# Altium schematic sheet ACMains_Connection_Sheet.SchDoc
size 420 x 297 mm
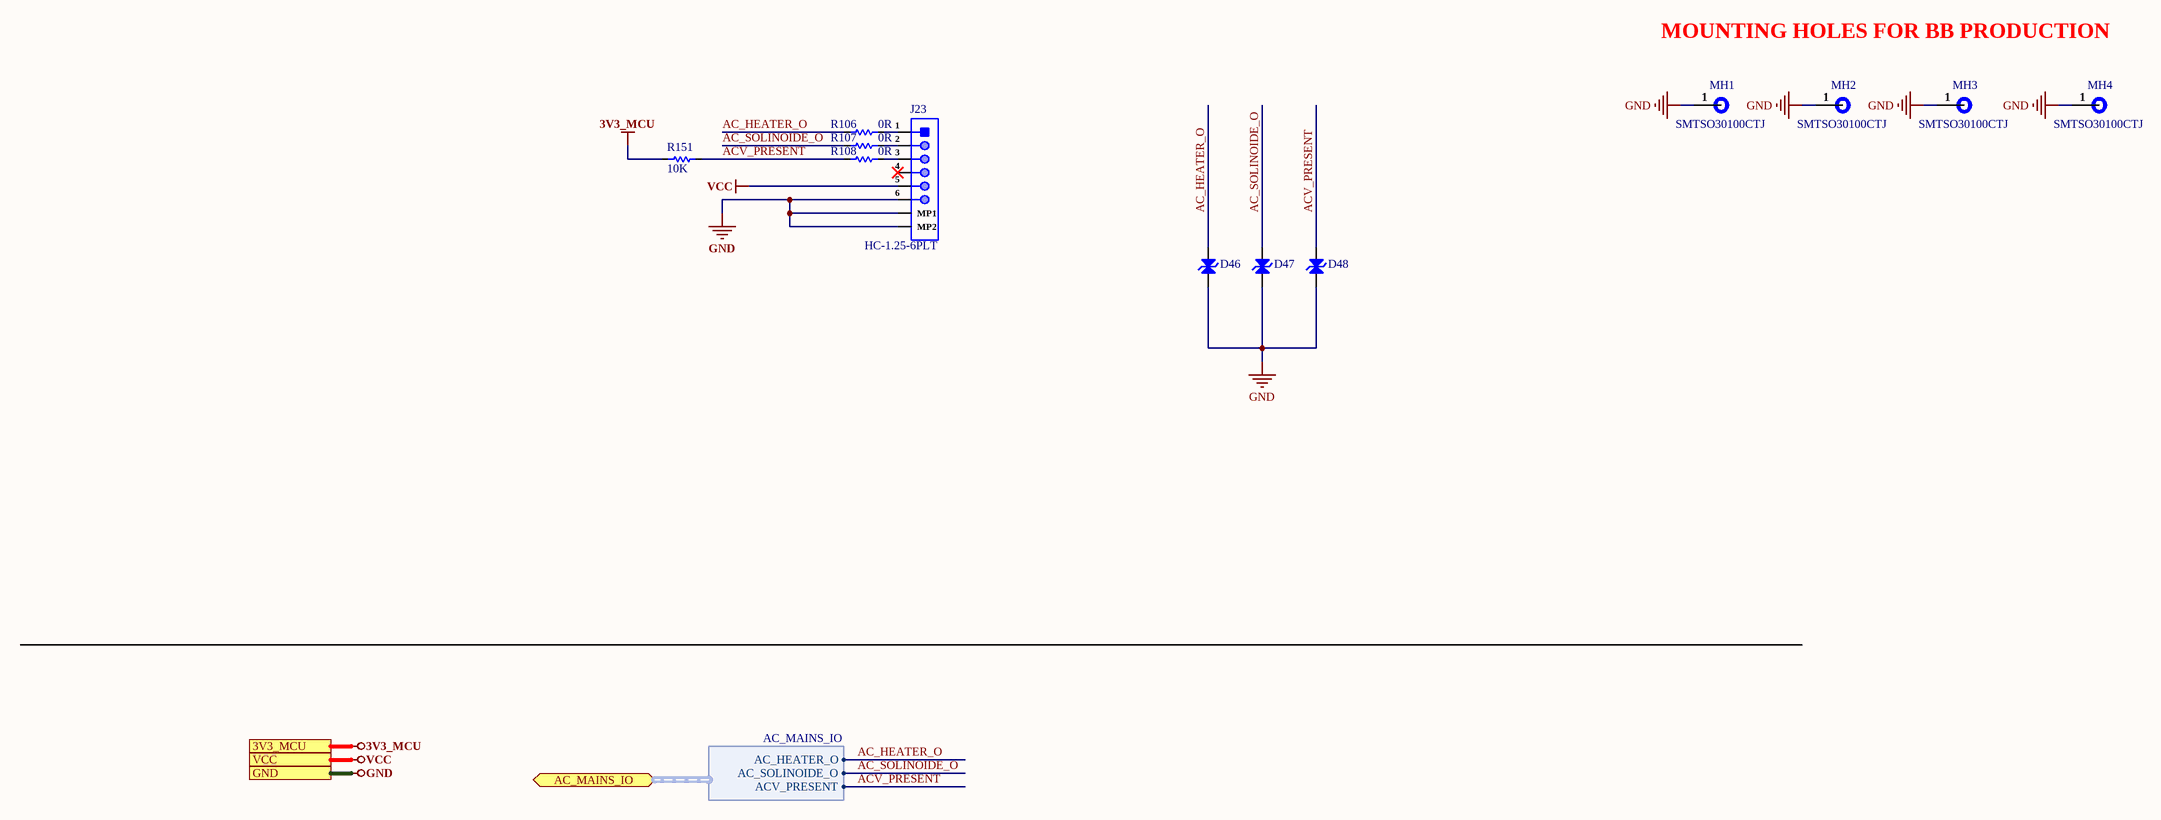
[diagram p0: ACMains_Connection_Sheet.SchDoc]

## Parts
D46  LESD8D3.3CAT5G  [SOD-882 Bi Directional]  (value not drawn)
D47  LESD8D3.3CAT5G  [SOD-882 Bi Directional]  (value not drawn)
D48  LESD8D3.3CAT5G  [SOD-882 Bi Directional]  (value not drawn)
J23  HC-1.25-6PLT  [HC-1.25-6PLT]
MH1  SMTSO30100CTJ  [SMTSO30100CTJ-]
MH2  SMTSO30100CTJ  [SMTSO30100CTJ-]
MH3  SMTSO30100CTJ  [SMTSO30100CTJ-]
MH4  SMTSO30100CTJ  [SMTSO30100CTJ-]
R106  0R  [Res-0603]
R107  0R  [Res-0603]
R108  0R  [Res-0603]
R151  10K  [Res-0603]

## Ports
3V3_MCU, AC_MAINS_IO (bidir, harness AC_MAINS_IO), GND, VCC

## Harnesses
AC_MAINS_IO: AC_HEATER_O, AC_SOLINOIDE_O, ACV_PRESENT

## Nets
3V3_MCU: R151.2 ; port 3V3_MCU
GND: D46.1(A) D47.1(A) D48.1(A) J23.6 J23.MP1 J23.MP2 MH1.1 MH2.1 MH3.1 MH4.1 ; port GND
VCC: J23.5 ; port VCC
AC_HEATER_O: D46.2(A) R106.1 ; port AC_MAINS_IO.AC_HEATER_O
AC_SOLINOIDE_O: D47.2(A) R107.1 ; port AC_MAINS_IO.AC_SOLINOIDE_O
ACV_PRESENT: D48.2(A) R108.1 R151.1 ; port AC_MAINS_IO.ACV_PRESENT
NetJ23_1: J23.1 R106.2
NetJ23_2: J23.2 R107.2
NetJ23_3: J23.3 R108.2

Not connected (* = marked no-connect by the designer): J23 4*

## Notes on the sheet
- MOUNTING HOLES FOR BB PRODUCTION
- File:
- Title:
- Date:
- Page
- Num:
- Total:
- Drawn By: Huzaifa Ali

## Library data of the parts
D46-D48 = LESD8D3.3CAT5G: 5V 10V 3.3V Bi-Directional SOD-882 ESD Protection Devices ROHS; Manufacturer: LRC; Manufacturer Part Number: LESD8D3.3CAT5G; Package: SOD-882; LCSC Part Number: C172409; Item Type: Protection Device; ComponentLink1Description: LCSC; ComponentLink1URL: https://www.lcsc.com/product-detail/span-style-background-color-ff0-ESD-span-Protection-Devices_LRC-LESD8D3-3CAT5G_C172409.html
J23 = HC-1.25-6PLT: 1x6P 6P PicoBlade(MX 1.25) Tin 6 -25℃~+85℃ 2A 1 1.25mm Brass Surface Mount,Vertical SMD,P=1.25mm Wire To Board Connector ROHS; Manufacturer: HCTL; Manufacturer Part Number: HC-1.25-6PLT; Package: SMD,P=1.25mm; LCSC Part Number: C2845392; Item Type: Connector; ComponentLink1Description: LCSC; ComponentLink1URL: https://lcsc.com/product-detail/Wire-To-Board-Connector_HCTL-HC-1-25-6PLT_C2845392.html?s_z=n_HC-1.25-6PLT
MH1-MH4 = SMTSO30100CTJ: Board Spacers, Standoffs RoHS; Manufacturer: Sinhoo; Item Type: Spacer; Manufacturer Part Number: SMTSO30100CTJ; Package: Custom; LCSC Part Number: C2916370; ComponentLink1Description: LCSC; ComponentLink1URL: https://www.lcsc.com/product-detail/C2916370.html
R106-R108 = RC0603JR-070RL: RES 0 OHM JUMPER 1/10W 0603; Manufacturer: Yageo; Resistance: 0mR; Tolerance: 1%; Power Rating: 100mW; Voltage Rating (DC): 50V; Temperature Coefficient: 200ppm/°C; Resistance Tolerance: 5%; Item Type: Resistor; Supplier 1: Digi-Key; Manufacturer Part Number: RC0603JR-070RL; RoHS: Yes; Category: Chip SMD Resistors; Stock 1: 18081776; Pricing 1: 1=0.10000, 10=0.01700, 25=0.01240, 50=0.00960, 100=0.00700, 250=0.00536, 500=0.00430, 1000=0.00316 (USD); Case/Package: 0603; Number of Pins: 2; Contact Plating: Tin,Matte; Case Code (Imperial): 0603; Case Code (Metric): 1608; Size Code: 0603; Min Operating Temperature: -55°C; Max Operating Temperature: 155°C; Resistor Type: Thick Film; Packaging: Tape and Reel; Termination: SMD/SMT; Series: RC; Technology: THICK FILM; Package Quantity: 5000; Voltage Rating: 50V; Features: Moisture Resistant; Max Power Dissipation: 100mW; Number of Terminations: 2; Construction: Rectangular; Length: 1.6mm; Width: 0.8mm; Height: 0.45mm; Depth: 0.8mm; Radiation Hardening: No; Reach SVHC Compliant: No SVHC; Lead Free: Lead Free; RoHS Compliant: Yes; Military Standard: Not; Supplier Part Number 1: 311-0.0GRCT-ND; LCSC Part Number: C95177
R151 = RK73G1JTTD1002F: RES 10K OHM 1% 1/10W 0603; Manufacturer: KOA Speer; Item Type: Resistor; Value: 10kR; Power Rating: 100mW; Voltage Rating: 75V; Temperature Coefficient: 50ppm/°C; LCSC Part Number: C362180; ComponentLink1Description: LCSC; Supplier: Digi-Key; Manufacturer Part Number: RK73G1JTTD1002F; Category: Chip SMD Resistors; Stock: 249394; Pricing: 1=0.22, 10=0.118, 50=0.0812, 100=0.0699, 500=0.0513, 1000=0.04545 (USD); Case/Package: 0603; Case Code (Imperial): 0603; Case Code (Metric): 1608; Min Operating Temperature: -55°C; Max Operating Temperature: 125°C; Tolerance: 1%; Packaging: Tape and Reel; Termination: SMD/SMT; Series: RK73G; Construction: Rectangular; Length: 1.6mm; Depth: 0.8mm; Military Standard: Not; RoHS Compliant: Yes; ComponentLink2URL: http://www.mouser.com/ds/2/219/RK73G-9863.pdf?src-supplier=Mouser; ComponentLink2Description: http://www.mouser.com/ds/2/219/RK73G-9863.pdf?src-supplier=Mouser